# Altium schematic sheet Deck Versal.SchDoc
size A3
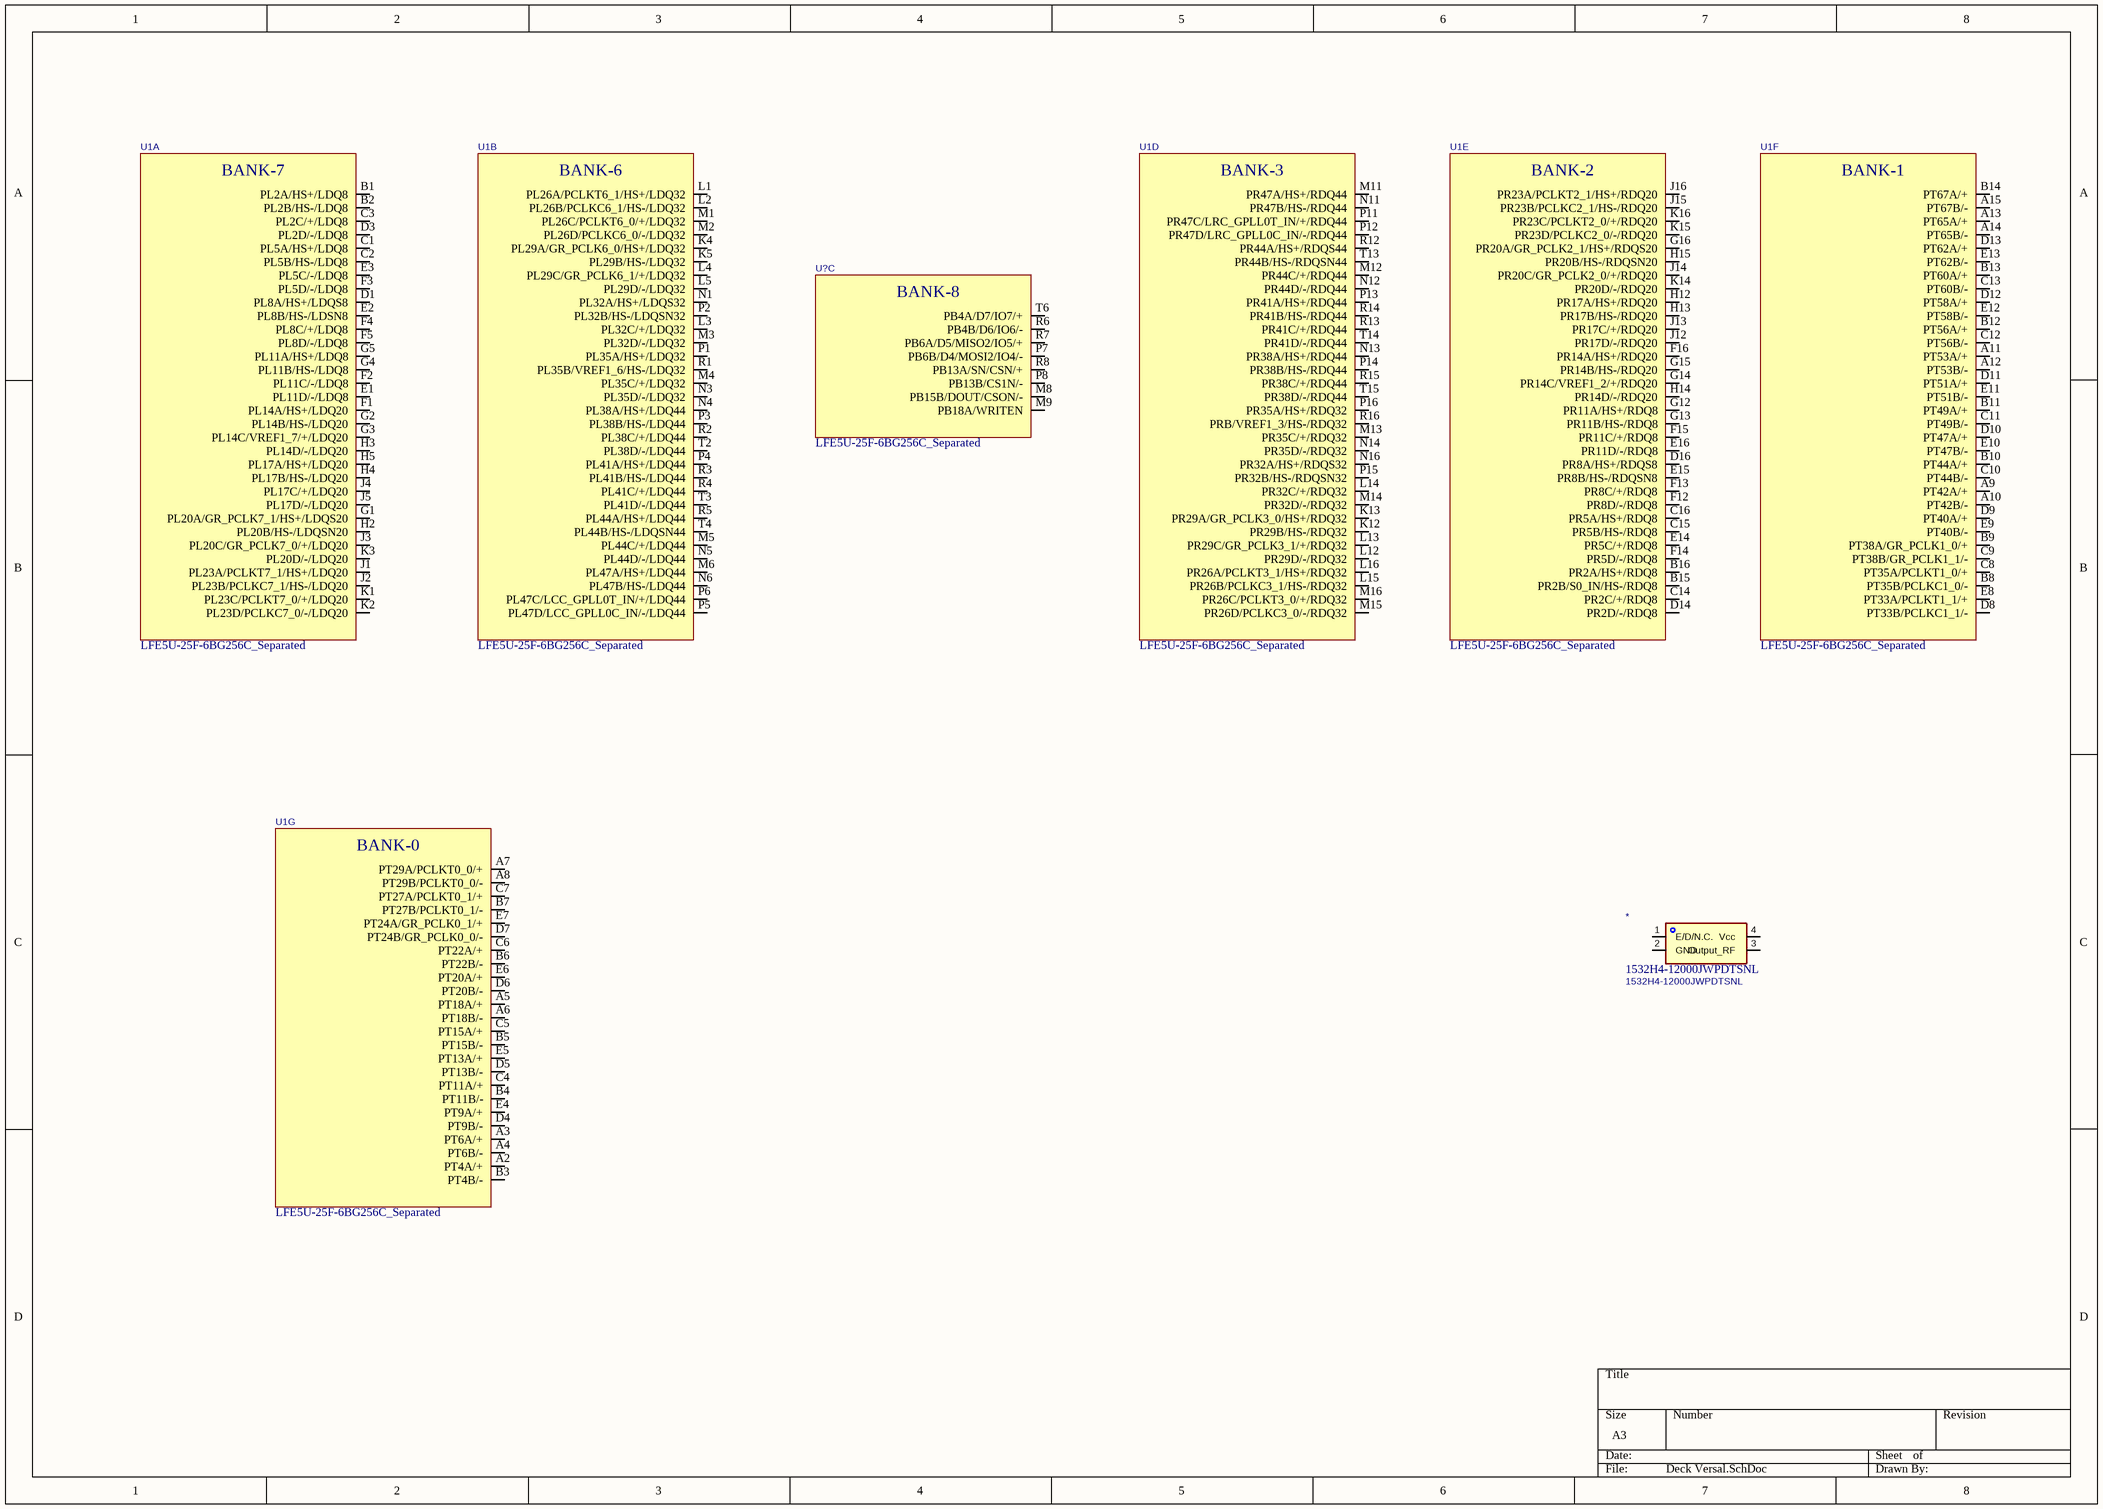
[diagram p0: Deck Versal.SchDoc]

## Parts
*  1532H4-12000JWPDTSNL  [OSC-SMD_4P-L3.2-W2.5-BL]
U1  LFE5U-25F-6BG256C_Separated  [CABGA-256_L14.0-W14.0-R16-C16-P0.80-TL]  (parts A,B,D,E,F,G of 8)
U?  LFE5U-25F-6BG256C_Separated  [CABGA-256_L14.0-W14.0-R16-C16-P0.80-TL]  (part C of 8)

## Nets

Not connected (* = marked no-connect by the designer): * 1(E/D/N.C.) 2(GND) 3(Output_RF) 4(Vcc); U1 A2(PT4A/+) A3(PT6A/+) A4(PT6B/-) A5(PT18A/+) A6(PT18B/-) A7(PT29A/PCLKT0_0/+) A8(PT29B/PCLKT0_0/-) A9(PT42A/+) A10(PT42B/-) A11(PT53A/+) A12(PT53B/-) A13(PT65A/+) A14(PT65B/-) A15(PT67B/-) B1(PL2A/HS+/LDQ8) B2(PL2B/HS-/LDQ8) B3(PT4B/-) B4(PT11B/-) B5(PT15B/-) B6(PT22B/-) B7(PT27B/PCLKT0_1/-) B8(PT35B/PCLKC1_0/-) B9(PT38A/GR_PCLK1_0/+) B10(PT44A/+) B11(PT49A/+) B12(PT56A/+) B13(PT60A/+) B14(PT67A/+) B15(PR2B/S0_IN/HS-/RDQ8) B16(PR2A/HS+/RDQ8) C1(PL5A/HS+/LDQ8) C2(PL5B/HS-/LDQ8) C3(PL2C/+/LDQ8) C4(PT11A/+) C5(PT15A/+) C6(PT22A/+) C7(PT27A/PCLKT0_1/+) C8(PT35A/PCLKT1_0/+) C9(PT38B/GR_PCLK1_1/-) C10(PT44B/-) C11(PT49B/-) C12(PT56B/-) C13(PT60B/-) C14(PR2C/+/RDQ8) C15(PR5B/HS-/RDQ8) C16(PR5A/HS+/RDQ8) D1(PL8A/HS+/LDQS8) D3(PL2D/-/LDQ8) D4(PT9B/-) D5(PT13B/-) D6(PT20B/-) D7(PT24B/GR_PCLK0_0/-) D8(PT33B/PCLKC1_1/-) D9(PT40A/+) D10(PT47A/+) D11(PT51A/+) D12(PT58A/+) D13(PT62A/+) D14(PR2D/-/RDQ8) D16(PR8A/HS+/RDQS8) E1(PL11D/-/LDQ8) E2(PL8B/HS-/LDSN8) E3(PL5C/-/LDQ8) E4(PT9A/+) E5(PT13A/+) E6(PT20A/+) E7(PT24A/GR_PCLK0_1/+) E8(PT33A/PCLKT1_1/+) E9(PT40B/-) E10(PT47B/-) E11(PT51B/-) E12(PT58B/-) E13(PT62B/-) E14(PR5C/+/RDQ8) E15(PR8B/HS-/RDQSN8) E16(PR11D/-/RDQ8) F1(PL14A/HS+/LDQ20) F2(PL11C/-/LDQ8) F3(PL5D/-/LDQ8) F4(PL8C/+/LDQ8) F5(PL8D/-/LDQ8) F12(PR8D/-/RDQ8) F13(PR8C/+/RDQ8) F14(PR5D/-/RDQ8) F15(PR11C/+/RDQ8) F16(PR14A/HS+/RDQ20) G1(PL20A/GR_PCLK7_1/HS+/LDQS20) G2(PL14B/HS-/LDQ20) G3(PL14C/VREF1_7/+/LDQ20) G4(PL11B/HS-/LDQ8) G5(PL11A/HS+/LDQ8) G12(PR11A/HS+/RDQ8) G13(PR11B/HS-/RDQ8) G14(PR14C/VREF1_2/+/RDQ20) G15(PR14B/HS-/RDQ20) G16(PR20A/GR_PCLK2_1/HS+/RDQS20) H2(PL20B/HS-/LDQSN20) H3(PL14D/-/LDQ20) H4(PL17B/HS-/LDQ20) H5(PL17A/HS+/LDQ20) H12(PR17A/HS+/RDQ20) H13(PR17B/HS-/RDQ20) H14(PR14D/-/RDQ20) H15(PR20B/HS-/RDQSN20) J1(PL23A/PCLKT7_1/HS+/LDQ20) J2(PL23B/PCLKC7_1/HS-/LDQ20) J3(PL20C/GR_PCLK7_0/+/LDQ20) J4(PL17C/+/LDQ20) J5(PL17D/-/LDQ20) J12(PR17D/-/RDQ20) J13(PR17C/+/RDQ20) J14(PR20C/GR_PCLK2_0/+/RDQ20) J15(PR23B/PCLKC2_1/HS-/RDQ20) J16(PR23A/PCLKT2_1/HS+/RDQ20) K1(PL23C/PCLKT7_0/+/LDQ20) K2(PL23D/PCLKC7_0/-/LDQ20) K3(PL20D/-/LDQ20) K4(PL29A/GR_PCLK6_0/HS+/LDQ32) K5(PL29B/HS-/LDQ32) K12(PR29B/HS-/RDQ32) K13(PR29A/GR_PCLK3_0/HS+/RDQ32) K14(PR20D/-/RDQ20) K15(PR23D/PCLKC2_0/-/RDQ20) K16(PR23C/PCLKT2_0/+/RDQ20) L1(PL26A/PCLKT6_1/HS+/LDQ32) L2(PL26B/PCLKC6_1/HS-/LDQ32) L3(PL32C/+/LDQ32) L4(PL29C/GR_PCLK6_1/+/LDQ32) L5(PL29D/-/LDQ32) L12(PR29D/-/RDQ32) L13(PR29C/GR_PCLK3_1/+/RDQ32) L14(PR32C/+/RDQ32) L15(PR26B/PCLKC3_1/HS-/RDQ32) L16(PR26A/PCLKT3_1/HS+/RDQ32) M1(PL26C/PCLKT6_0/+/LDQ32) M2(PL26D/PCLKC6_0/-/LDQ32) M3(PL32D/-/LDQ32) M4(PL35C/+/LDQ32) M5(PL44C/+/LDQ44) M6(PL47A/HS+/LDQ44) M11(PR47A/HS+/RDQ44) M12(PR44C/+/RDQ44) M13(PR35C/+/RDQ32) M14(PR32D/-/RDQ32) M15(PR26D/PCLKC3_0/-/RDQ32) M16(PR26C/PCLKT3_0/+/RDQ32) N1(PL32A/HS+/LDQS32) N3(PL35D/-/LDQ32) N4(PL38A/HS+/LDQ44) N5(PL44D/-/LDQ44) N6(PL47B/HS-/LDQ44) N11(PR47B/HS-/RDQ44) N12(PR44D/-/RDQ44) N13(PR38A/HS+/RDQ44) N14(PR35D/-/RDQ32) N16(PR32A/HS+/RDQS32) P1(PL35A/HS+/LDQ32) P2(PL32B/HS-/LDQSN32) P3(PL38B/HS-/LDQ44) P4(PL41A/HS+/LDQ44) P5(PL47D/LCC_GPLL0C_IN/-/LDQ44) P6(PL47C/LCC_GPLL0T_IN/+/LDQ44) P11(PR47C/LRC_GPLL0T_IN/+/RDQ44) P12(PR47D/LRC_GPLL0C_IN/-/RDQ44) P13(PR41A/HS+/RDQ44) P14(PR38B/HS-/RDQ44) P15(PR32B/HS-/RDQSN32) P16(PR35A/HS+/RDQ32) R1(PL35B/VREF1_6/HS-/LDQ32) R2(PL38C/+/LDQ44) R3(PL41B/HS-/LDQ44) R4(PL41C/+/LDQ44) R5(PL44A/HS+/LDQ44) R12(PR44A/HS+/RDQS44) R13(PR41C/+/RDQ44) R14(PR41B/HS-/RDQ44) R15(PR38C/+/RDQ44) R16(PRB/VREF1_3/HS-/RDQ32) T2(PL38D/-/LDQ44) T3(PL41D/-/LDQ44) T4(PL44B/HS-/LDQSN44) T13(PR44B/HS-/RDQSN44) T14(PR41D/-/RDQ44) T15(PR38D/-/RDQ44); U? M8(PB15B/DOUT/CSON/-) M9(PB18A/WRITEN) P7(PB6B/D4/MOSI2/IO4/-) P8(PB13B/CS1N/-) R6(PB4B/D6/IO6/-) R7(PB6A/D5/MISO2/IO5/+) R8(PB13A/SN/CSN/+) T6(PB4A/D7/IO7/+)

## Notes on the sheet
- (in symbol LFE5U-25F-6BG256C_Separated, part A) BANK-7
- (in symbol LFE5U-25F-6BG256C_Separated, part B) BANK-6
- (in symbol LFE5U-25F-6BG256C_Separated, part C) BANK-8
- (in symbol LFE5U-25F-6BG256C_Separated, part D) BANK-3
- (in symbol LFE5U-25F-6BG256C_Separated, part E) BANK-2
- (in symbol LFE5U-25F-6BG256C_Separated, part F) BANK-1
- (in symbol LFE5U-25F-6BG256C_Separated, part G) BANK-0

## Library data of the parts
* = 1532H4-12000JWPDTSNL: Manufacturer: HCI(杭晶); ki_keywords: Oscillators; Footprint: easyeda2kicad:OSC-SMD_4P-L3.2-W2.5-BL; Supplier: https://www.lcsc.com/datasheet/C5383163.pdf; MPN: 1532H4-12000JWPDTSNL; LCSC Part: C5383163; Value: 1532H4-12000JWPDTSNL
U1 U? = LFE5U-25F-6BG256C_Separated: Manufacturer: LATTICE(莱迪思); ki_keywords: CPLD/FPGA; Footprint: easyeda2kicad:CABGA-256_L14.0-W14.0-R16-C16-P0.80-TL; Supplier: https://www.lcsc.com/datasheet/C1521614.pdf; MPN: LFE5U-25F-6BG256C; LCSC Part: C1521614